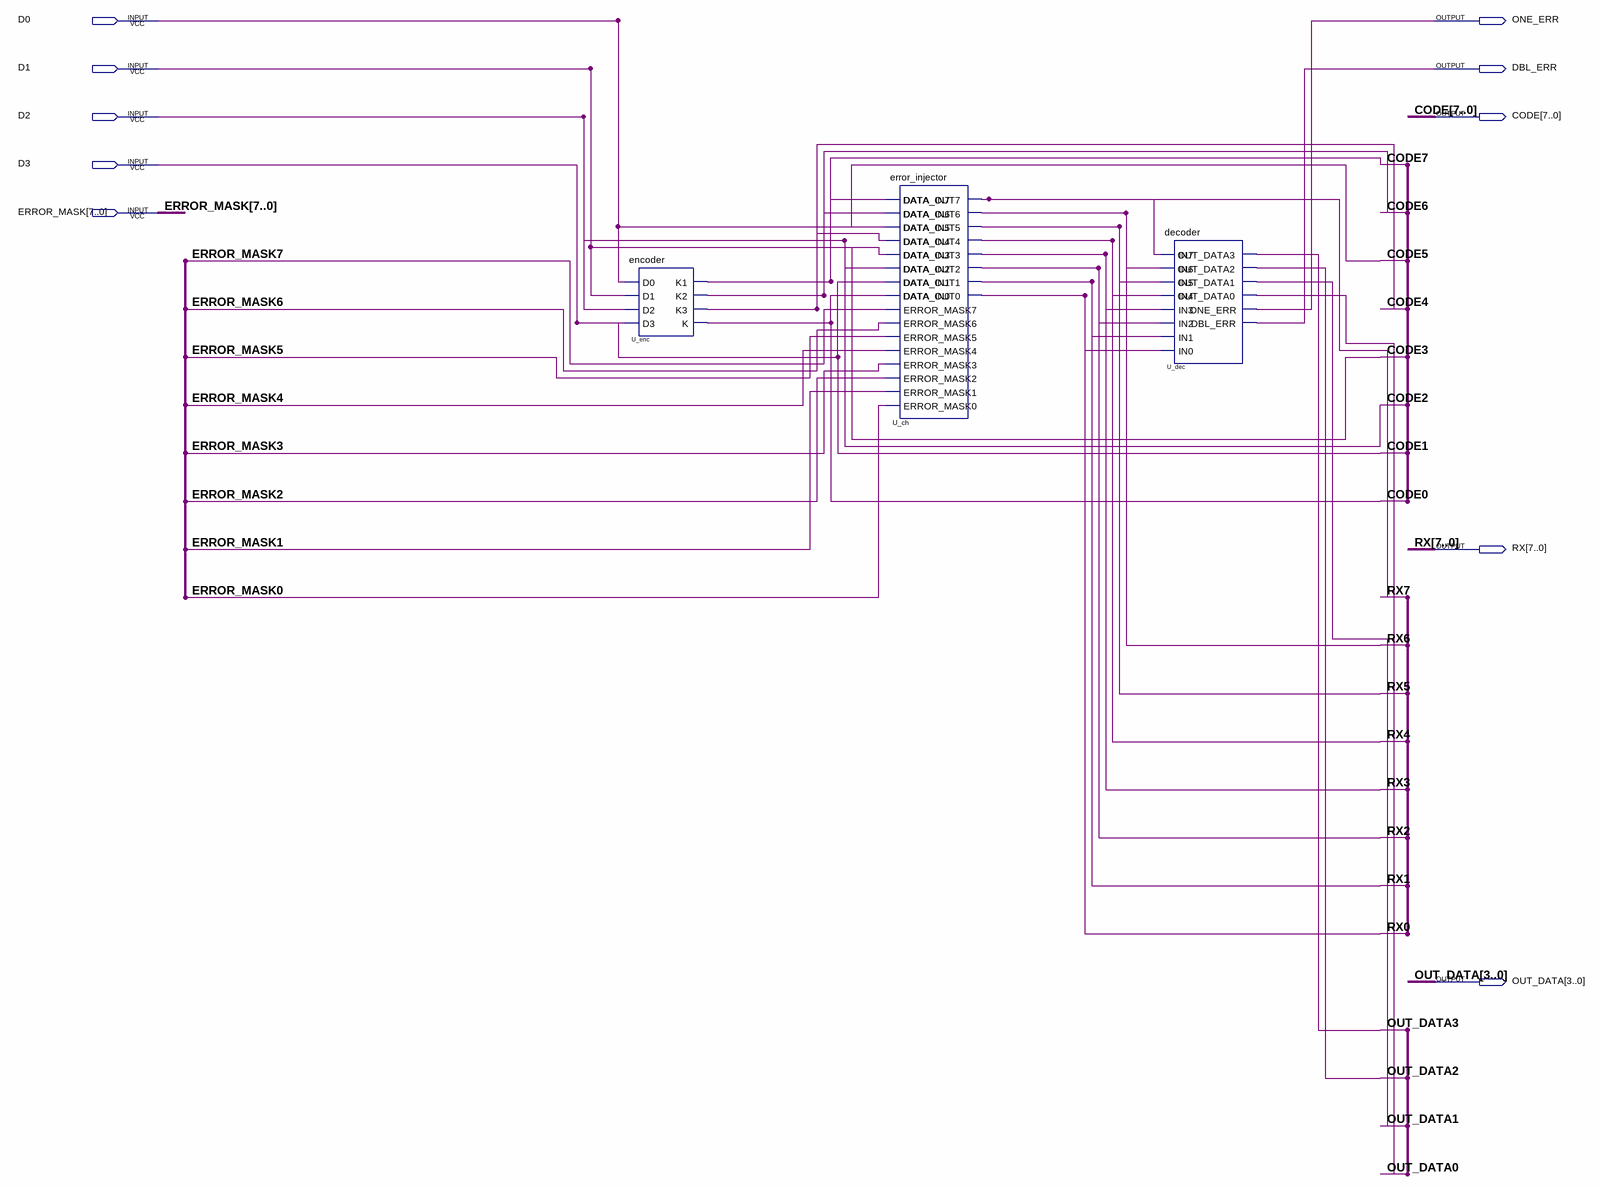
[diagram p0: schematic sheet]
// Quartus schematic hamming_top.bdf as structural Verilog: 3 symbols, 10 pins
module hamming_top (
  input  D0,
  input  D1,
  input  D2,
  input  D3,
  input  [7:0] ERROR_MASK,
  output ONE_ERR,
  output DBL_ERR,
  output [7:0] CODE,
  output [7:0] RX,
  output [3:0] OUT_DATA
);

  encoder U_enc (.D0(D0), .D1(D1), .D2(D2), .D3(D3), .K1(CODE[7]), .K2(CODE[6]), .K3(CODE[4]), .K(CODE[0]));
  error_injector U_ch (
    .DATA_IN7(CODE[7]), .DATA_IN6(CODE[6]), .DATA_IN5(D0), .DATA_IN4(CODE[4]), .DATA_IN3(D1), .DATA_IN2(D2),
    .DATA_IN1(D3), .DATA_IN0(CODE[0]), .ERROR_MASK7(ERROR_MASK[7]), .ERROR_MASK6(ERROR_MASK[6]),
    .ERROR_MASK5(ERROR_MASK[5]), .ERROR_MASK4(ERROR_MASK[4]), .ERROR_MASK3(ERROR_MASK[3]),
    .ERROR_MASK2(ERROR_MASK[2]), .ERROR_MASK1(ERROR_MASK[1]), .ERROR_MASK0(ERROR_MASK[0]), .DATA_OUT7(RX[7]),
    .DATA_OUT6(RX[6]), .DATA_OUT5(RX[5]), .DATA_OUT4(RX[4]), .DATA_OUT3(RX[3]), .DATA_OUT2(RX[2]),
    .DATA_OUT1(RX[1]), .DATA_OUT0(RX[0]));
  decoder U_dec (
    .IN7(RX[7]), .IN6(RX[6]), .IN5(RX[5]), .IN4(RX[4]), .IN3(RX[3]), .IN2(RX[2]), .IN1(RX[1]), .IN0(RX[0]),
    .OUT_DATA3(OUT_DATA[3]), .OUT_DATA2(OUT_DATA[2]), .OUT_DATA1(OUT_DATA[1]), .OUT_DATA0(OUT_DATA[0]),
    .ONE_ERR(ONE_ERR), .DBL_ERR(DBL_ERR));

  assign {CODE[5], CODE[3:1]} = {D0, D1, D2, D3};

  // Other names for the same wires on the sheet: CODE1 = D3; CODE2 = D2; CODE3 = D1; CODE5 = D0
endmodule
